# EAGLE design Box of Beezz - Drone Synth V2 (EAGLE 9.6.2)
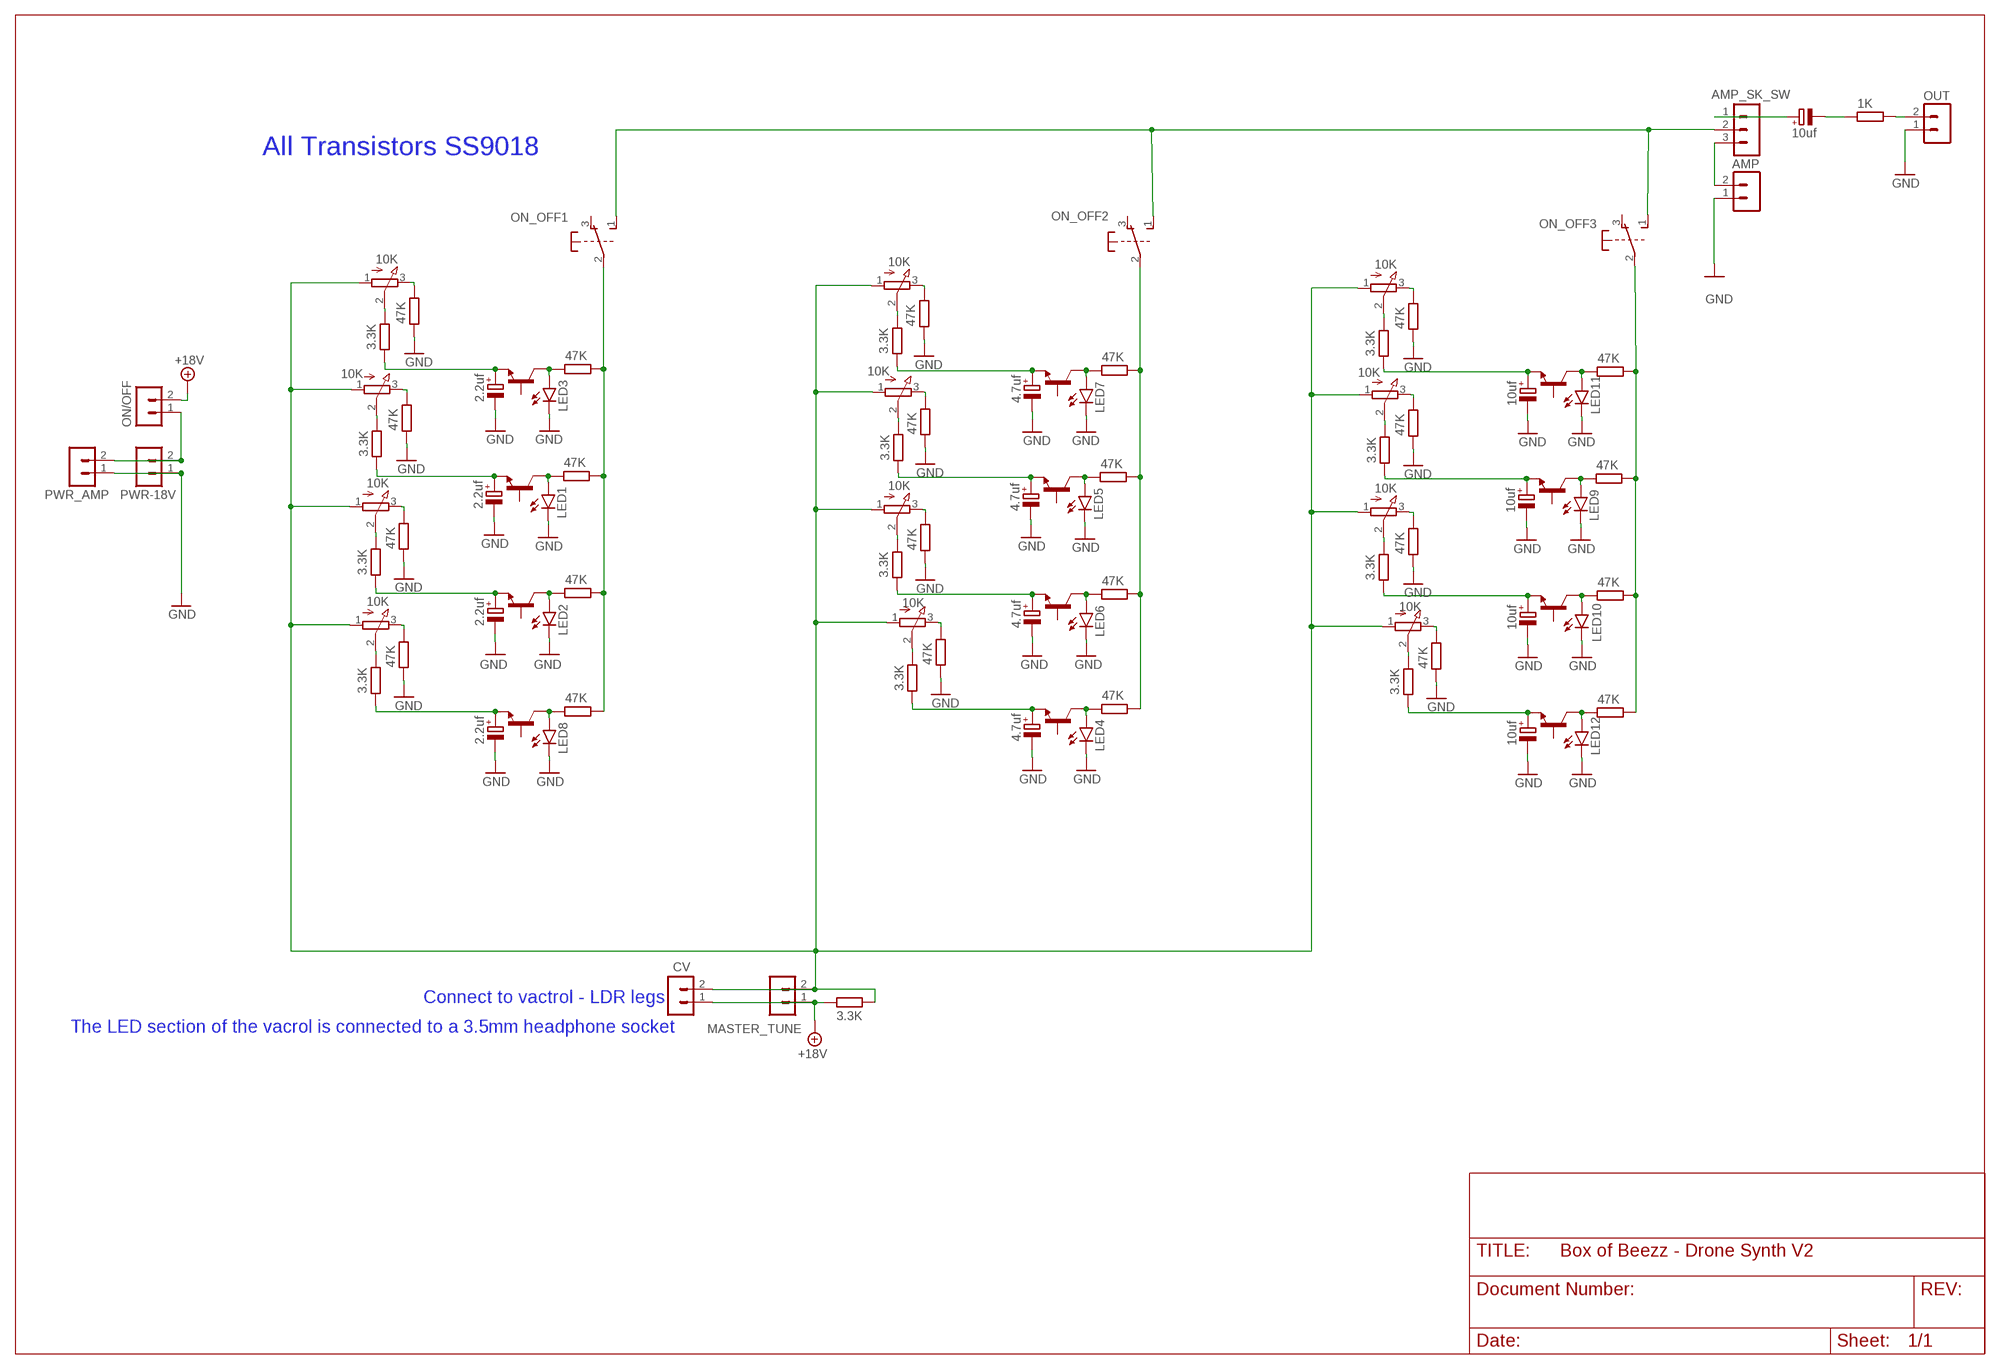
[diagram p0: schematic, sheet 1]

## Parts
AMP  B2B-PH-KL  [B2B-PH-K-S]
AMP_SK_SW  B3B-PH-K-S  [B3B-PH-K-S]
C1  2.2uf  CPOL-EUE2-5  [E2-5]
C2  2.2uf  CPOL-EUE2-5  [E2-5]
C3  2.2uf  CPOL-EUE2-5  [E2-5]
C4  10uf  CPOL-EUE2-5  [E2-5]
C5  4.7uf  CPOL-EUE2-5  [E2-5]
C6  4.7uf  CPOL-EUE2-5  [E2-5]
C7  4.7uf  CPOL-EUE2-5  [E2-5]
C8  4.7uf  CPOL-EUE2-5  [E2-5]
C9  2.2uf  CPOL-EUE2-5  [E2-5]
C10  10uf  CPOL-EUE2-5  [E2-5]
C11  10uf  CPOL-EUE2-5  [E2-5]
C12  10uf  CPOL-EUE2-5  [E2-5]
C13  10uf  CPOL-EUE2-5  [E2-5]
CV  B2B-PH-KL  [B2B-PH-K-S]
LED1  LED3MM  [LED3MM]
LED2  LED3MM  [LED3MM]
LED3  LED3MM  [LED3MM]
LED4  LED3MM  [LED3MM]
LED5  LED3MM  [LED3MM]
LED6  LED3MM  [LED3MM]
LED7  LED3MM  [LED3MM]
LED8  LED3MM  [LED3MM]
LED9  LED3MM  [LED3MM]
LED10  LED3MM  [LED3MM]
LED11  LED3MM  [LED3MM]
LED12  LED3MM  [LED3MM]
MASTER_TUNE  B2B-PH-KL  [B2B-PH-K-S]
ON/OFF  B2B-PH-KL  [B2B-PH-K-S]
ON_OFF1  SWITCH-6PIN  [SWITCH-6PIN]
ON_OFF2  SWITCH-6PIN  [SWITCH-6PIN]
ON_OFF3  SWITCH-6PIN  [SWITCH-6PIN]
OUT  B2B-PH-KL  [B2B-PH-K-S]
PWR-18V  B2B-PH-KL  [B2B-PH-K-S]
PWR_AMP  B2B-PH-KL  [B2B-PH-K-S]
R1  47K  R-EU_0207/10  [0207/10]
R2  10K  EVUF2A  [EVUF]
R3  47K  R-EU_0207/10  [0207/10]
R4  3.3K  R-EU_0207/10  [0207/10]
R5  47K  R-EU_0207/10  [0207/10]
R6  10K  EVUF2A  [EVUF]
R7  3.3K  R-EU_0207/10  [0207/10]
R8  47K  R-EU_0207/10  [0207/10]
R9  10K  EVUF2A  [EVUF]
R10  3.3K  R-EU_0207/10  [0207/10]
R11  3.3K  R-EU_0207/10  [0207/10]
R12  1K  R-EU_0207/10  [0207/10]
R13  47K  R-EU_0207/10  [0207/10]
R14  47K  R-EU_0207/10  [0207/10]
R15  10K  EVUF2A  [EVUF]
R16  10K  EVUF2A  [EVUF]
R17  47K  R-EU_0207/10  [0207/10]
R18  47K  R-EU_0207/10  [0207/10]
R19  10K  EVUF2A  [EVUF]
R20  47K  R-EU_0207/10  [0207/10]
R21  47K  R-EU_0207/10  [0207/10]
R22  10K  EVUF2A  [EVUF]
R23  3.3K  R-EU_0207/10  [0207/10]
R24  3.3K  R-EU_0207/10  [0207/10]
R25  3.3K  R-EU_0207/10  [0207/10]
R26  3.3K  R-EU_0207/10  [0207/10]
R27  47K  R-EU_0207/10  [0207/10]
R28  10K  EVUF2A  [EVUF]
R29  3.3K  R-EU_0207/10  [0207/10]
R30  3.3K  R-EU_0207/10  [0207/10]
R31  47K  R-EU_0207/10  [0207/10]
R32  10K  EVUF2A  [EVUF]
R33  3.3K  R-EU_0207/10  [0207/10]
R34  47K  R-EU_0207/10  [0207/10]
R35  10K  EVUF2A  [EVUF]
R36  47K  R-EU_0207/10  [0207/10]
R37  47K  R-EU_0207/10  [0207/10]
R38  47K  R-EU_0207/10  [0207/10]
R39  47K  R-EU_0207/10  [0207/10]
R40  47K  R-EU_0207/10  [0207/10]
R41  47K  R-EU_0207/10  [0207/10]
R42  47K  R-EU_0207/10  [0207/10]
R43  47K  R-EU_0207/10  [0207/10]
R44  10K  EVUF2A  [EVUF]
R45  3.3K  R-EU_0207/10  [0207/10]
R46  47K  R-EU_0207/10  [0207/10]
R47  47K  R-EU_0207/10  [0207/10]
R48  10K  EVUF2A  [EVUF]
R49  3.3K  R-EU_0207/10  [0207/10]
R50  47K  R-EU_0207/10  [0207/10]
T1  2N3904  [TO92]
T2  2N3904  [TO92]
T3  2N3904  [TO92]
T4  2N3904  [TO92]
T5  2N3904  [TO92]
T6  2N3904  [TO92]
T7  2N3904  [TO92]
T8  2N3904  [TO92]
T9  2N3904  [TO92]
T10  2N3904  [TO92]
T11  2N3904  [TO92]
T12  2N3904  [TO92]

## Nets
+12V: CV.1 MASTER_TUNE.1 ON/OFF.2 R11.1 ; supply symbol labelled +18V
GND: AMP.1 C1.- C2.- C3.- C5.- C6.- C7.- C8.- C9.- C10.- C11.- C12.- C13.- LED1.K(C) LED2.K(C) LED3.K(C) LED4.K(C) LED5.K(C) LED6.K(C) LED7.K(C) LED8.K(C) LED9.K(C) LED10.K(C) LED11.K(C) LED12.K(C) OUT.1 PWR-18V.1 PWR_AMP.1 R13.1 R17.1 R20.1 R36.1 R37.1 R38.1 R39.1 R40.1 R41.1 R42.1 R46.1 R50.1
N$1: C1.+ R7.1 T1.3(E)
N$2: R4.2 R9.2(S)
N$4: LED1.A R1.1 T1.1(C)
N$5: LED2.A R5.1 T2.1(C)
N$6: C2.+ R10.1 T2.3(E)
N$7: R2.2(S) R7.2
N$8: LED3.A R8.1 T3.1(C)
N$9: C3.+ R4.1 T3.3(E)
N$10: R6.2(S) R10.2
N$11: R6.3(E) R20.2
N$12: R2.3(E) R17.2
N$13: R9.3(E) R13.2
N$14: LED5.A R14.1 T5.1(C)
N$15: C8.+ R23.1 T7.3(E)
N$16: ON/OFF.1 PWR-18V.2 PWR_AMP.2
N$17: LED8.A R3.1 T4.1(C)
N$18: R28.2(S) R30.2
N$19: LED6.A R18.1 T6.1(C)
N$20: C5.+ R24.1 T5.3(E)
N$21: R32.2(S) R33.2
N$23: C7.+ R25.1 T6.3(E)
N$24: ON_OFF2.2(1:P) R14.2 R18.2 R21.2 R43.2
N$25: ON_OFF3.2(1:P) R27.2 R31.2 R34.2 R47.2
N$26: C4.- R12.1
N$27: AMP_SK_SW.1 C4.+
N$28: C9.+ R29.1 T4.3(E)
N$29: OUT.2 R12.2
N$30: LED9.A R27.1 T9.1(C)
N$31: C13.+ R26.1 T11.3(E)
N$32: AMP.2 AMP_SK_SW.3
N$33: LED10.A R31.1 T10.1(C)
N$34: C11.+ R30.1 T9.3(E)
N$35: R26.2 R35.2(S)
N$36: LED11.A R34.1 T11.1(C)
N$37: C12.+ R33.1 T10.3(E)
N$38: R22.2(S) R23.2
N$39: R15.2(S) R24.2
N$40: R19.2(S) R25.2
N$41: LED7.A R21.1 T7.1(C)
N$42: ON_OFF1.2(1:P) R1.2 R3.2 R5.2 R8.2
N$43: AMP_SK_SW.2 ON_OFF1.1(1:S) ON_OFF2.1(1:S) ON_OFF3.1(1:S)
N$44: R32.3(E) R41.2
N$45: R28.3(E) R40.2
N$46: R35.3(E) R39.2
N$47: R22.3(E) R36.2
N$48: R15.3(E) R37.2
N$49: R19.3(E) R38.2
N$51: R16.2(S) R29.2
N$52: R16.3(E) R42.2
N$53: LED4.A R43.1 T8.1(C)
N$54: C6.+ R45.1 T8.3(E)
N$57: R44.2(S) R45.2
N$58: R44.3(E) R46.2
N$59: LED12.A R47.1 T12.1(C)
N$60: C10.+ R49.1 T12.3(E)
N$62: CV.2 MASTER_TUNE.2 R2.1(A) R6.1(A) R9.1(A) R11.2 R15.1(A) R16.1(A) R19.1(A) R22.1(A) R28.1(A) R32.1(A) R35.1(A) R44.1(A) R48.1(A)
N$63: R48.2(S) R49.2
N$64: R48.3(E) R50.2
Unconnected: ON_OFF1.3(1:O) ON_OFF1.4(2:S) ON_OFF1.5(2:P) ON_OFF1.6(2:O) ON_OFF2.3(1:O) ON_OFF2.4(2:S) ON_OFF2.5(2:P) ON_OFF2.6(2:O) ON_OFF3.3(1:O) ON_OFF3.4(2:S) ON_OFF3.5(2:P) ON_OFF3.6(2:O) T1.2(B) T2.2(B) T3.2(B) T4.2(B) T5.2(B) T6.2(B) T7.2(B) T8.2(B) T9.2(B) T10.2(B) T11.2(B) T12.2(B)

## Notes on the sheet
- All Transistors SS9018
- Connect to vactrol - LDR legs
- The LED section of the vacrol is connected to a 3.5mm headphone socket

## Library data of the parts
AMP CV MASTER_TUNE ON/OFF OUT PWR-18V PWR_AMP = con-JST PH:B2B-PH: JST PH series header 2.00mm pitch disconnectable crimp style connectors, vertical (side entry type), 2 pins
AMP_SK_SW = con-JST PH:B3B-PH: JST PH series header 2.00mm pitch disconnectable crimp style connectors, vertical (side entry type), 3 pins
C1-C13 = rcl:CPOL-EU: POLARIZED CAPACITOR, European symbol; SPICEPREFIX: C
LED1-LED12 = led:LED: LED OSRAM: - CHIPLED LG R971, LG N971, LY N971, LG Q971, LY Q971, LO R971, LY R971 LH N974, LH R974 LS Q976, LO Q976, LY Q976 LO Q996 - Hyper CHIPLED LW Q18S LB Q993, LB Q99A, LB R99A - SideLED LS A670, LO A670, LY A670, LG A670, LP A670 LB A673, LV A673, LT A673, LW A673 LH A674 LY A675 LS A676, LA A676, LO A676, LY A676, LW A676 LS A679, LY A679, LG A679 - Hyper Micro SIDELED® LS Y876, LA Y876, LO Y876, LY Y876 LT Y87S - SmartLED LW L88C, LW L88S LB L89C, LB L89S, LG L890 LS L89K, LO L89K, LY L89K LS L896, LA L896, LO L896, LY L896 - TOPLED LS T670, LO T670, LY T670, LG T670, LP T670 LSG T670, LSP T670, LSY T670, LOP T670, LYG T670 LG T671, LOG T671, LSG T671 LB T673, LV T673, LT T673, LW T673 LH T674 LS T676, LA T676, LO T676, LY T676, LB T676, LH T676, LSB T676, LW T676 LB T67C, LV T67C, LT T67C, LS T67K, LO T67K, LY T67K, LW E67C LS E67B, LA E67B, LO E67B, LY E67B, LB E67C, LV E67C, LT E67C LW T67C LS T679, LY T679, LG T679 LS T770, LO T770, LY T770, LG T770, LP T770 LB T773, LV T773, LT T773, LW T773 LH T774 LS E675, LA E675, LY E675, LS T675 LS T776, LA T776, LO T776, LY T776, LB T776 LHGB T686 LT T68C, LB T68C - Hyper Mini TOPLED® LB M676 - Mini TOPLED Santana® LG M470 LS M47K, LO M47K, LY M47K Source: http://www.osram.convergy.de LUXEON: - LUMILED® LXK2-PW12-R00, LXK2-PW12-S00, LXK2-PW14-U00, LXK2-PW14-V00 LXK2-PM12-R00, LXK2-PM12-S00, LXK2-PM14-U00 LXK2-PE12-Q00, LXK2-PE12-R00, LXK2-PE12-S00, LXK2-PE14-T00, LXK2-PE14-U00 LXK2-PB12-K00, LXK2-PB12-L00, LXK2-PB12-M00, LXK2-PB14-N00, LXK2-PB14-P00, LXK2-PB14-Q00 LXK2-PR12-L00, LXK2-PR12-M00, LXK2-PR14-Q00, LXK2-PR14-R00 LXK2-PD12-Q00, LXK2-PD12-R00, LXK2-PD12-S00 LXK2-PH12-R00, LXK2-PH12-S00 LXK2-PL12-P00, LXK2-PL12-Q00, LXK2-PL12-R00 Source: www.luxeon.com KINGBRIGHT: KA-3528ASYC Source: www.kingbright.com
ON_OFF1-ON_OFF3 = My Library:SWITCH-6PIN: ITT SWITCH
R1 R3-R5 R7 R8 R10-R14 R17 R18 R20 R21 R23-R27 R29-R31 R33 R34 R36-R43 R45-R47 R49 R50 = rcl:R-EU_: RESISTOR, European symbol; SPICEPREFIX: R
R2 R6 R9 R15 R16 R19 R22 R28 R32 R35 R44 R48 = pot:EVU: 9 mm Square Rotary Potentiometers Source: Panasonic
T1-T12 = transistor:2N3904: NPN TRANSISTOR

## Board
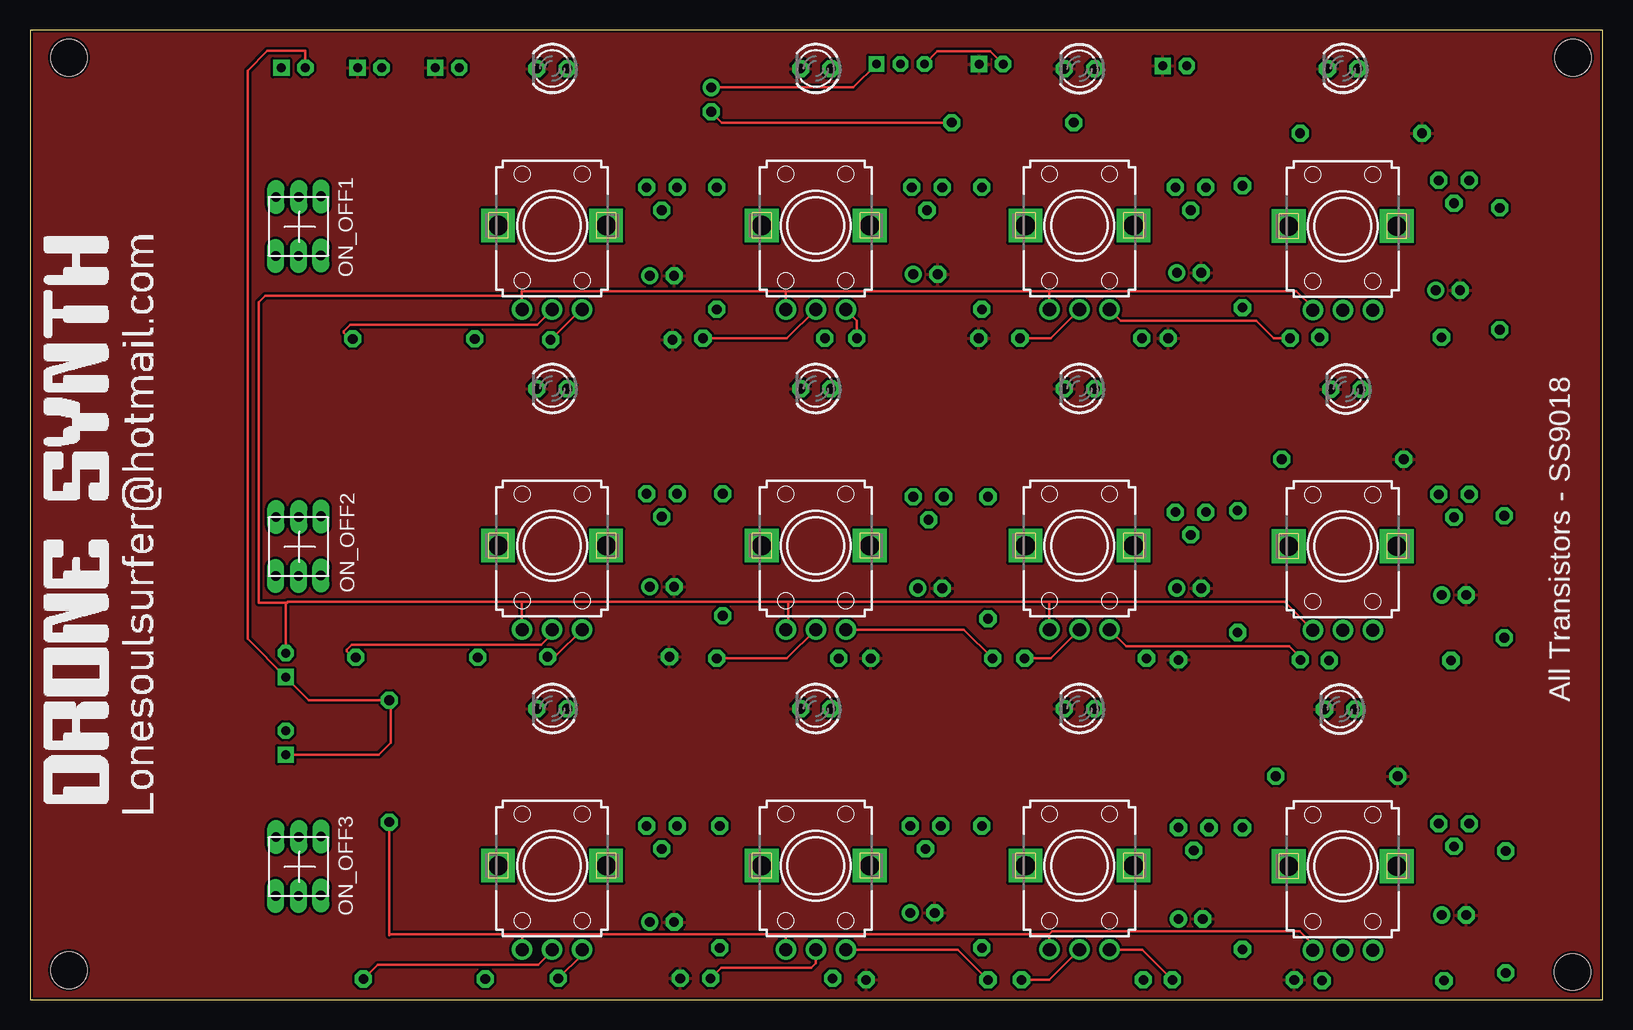
[diagram p1: board, top side]
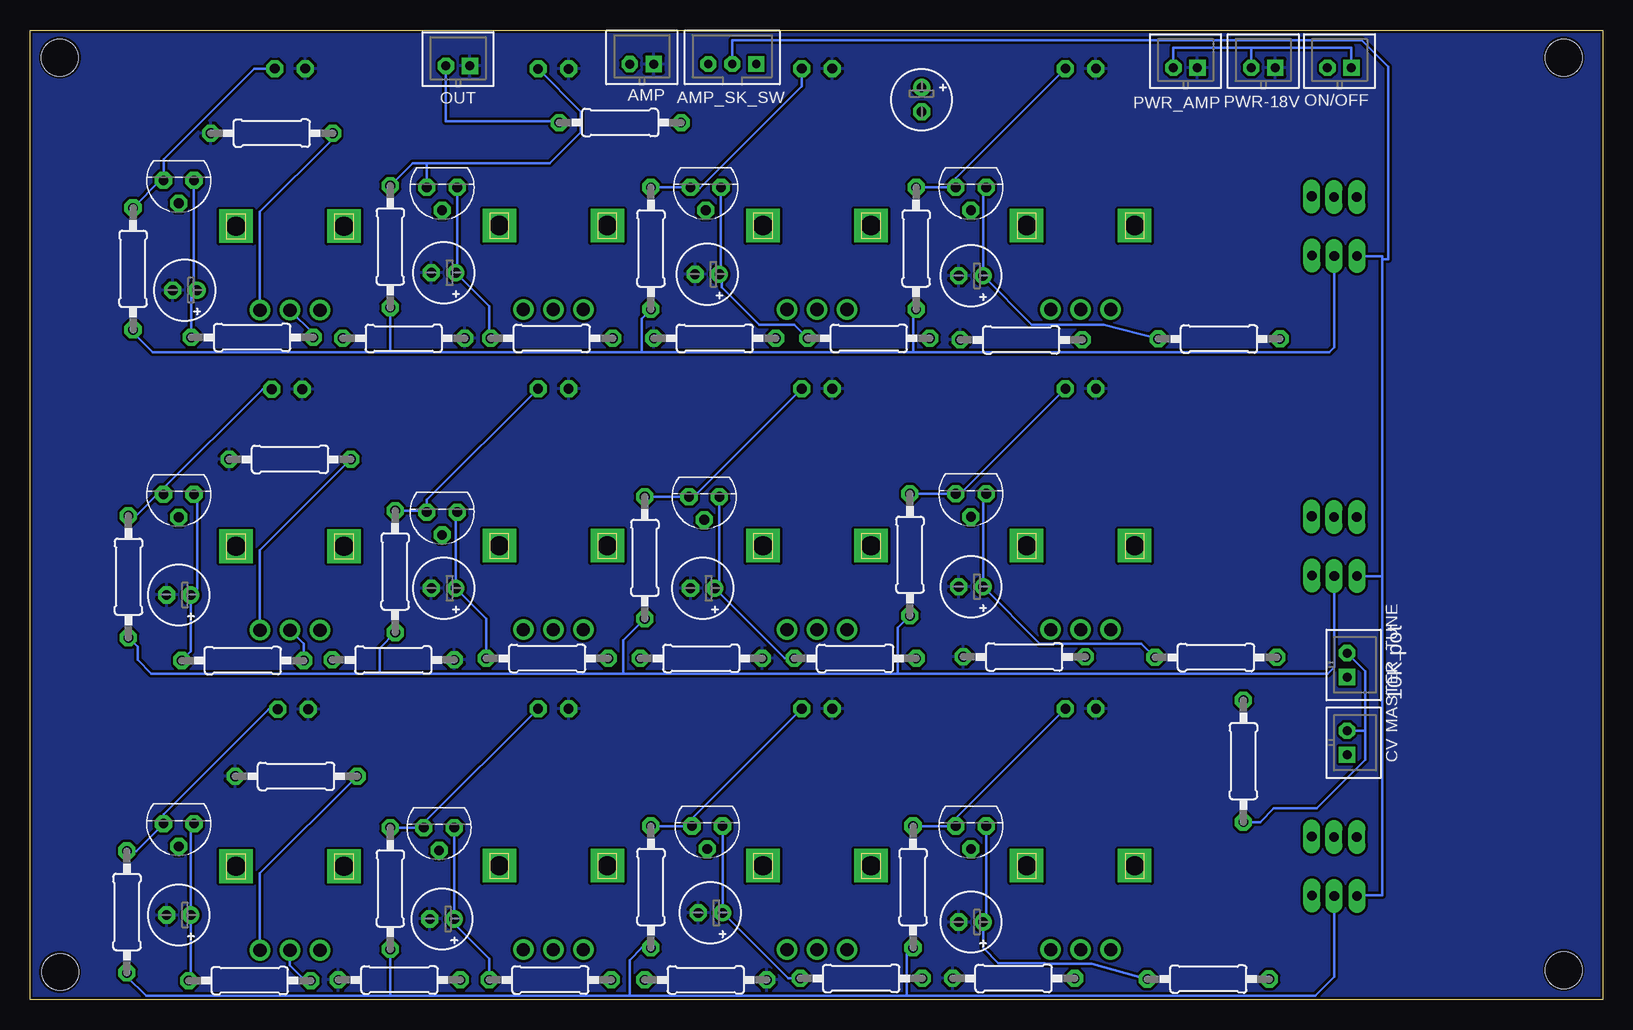
[diagram p2: board, bottom side, seen from below]

Size 131.06 x 80.81 mm. Coordinates in mm from the lower left corner, seen from the top.
Outline: 0,0 131.06,0 131.06,80.81 0,80.79 0,0
Copper layers (1*16): Top 0.035mm / dielectric 1.5mm / Bottom 0.035mm
Design rules "SparkFun": minimum track width 8mil, minimum drill 20mil, track to track 8mil, track to pad 8mil, pad to pad 8mil, via to via 8mil, smd to smd 8mil, copper to edge 8mil, drill to drill 8mil, minimum pad ring 12mil, minimum via ring 10mil, stop-mask expansion 4mil, vias tented up to drill 20mil, thermal gap 10mil
Holes 3.05 mm at 3.25,78.51 3.25,2.46 128.55,2.31 128.57,78.51

### Footprints (pad centres in the part's own frame; a part is rotated, then mirrored left to right if it is on the bottom)
B2B-PH-K-S = drill 0.75 pad 1.3 square: 1 1,0 | drill 0.75 pad 1.3 octagon: 2 -1,0
B3B-PH-K-S = drill 0.7 pad 1.3 square: 1 2,0 | drill 0.7 pad 1.3 octagon: 2 0,0; 3 -2,0
E2-5 = drill 0.813 pad 1.27: + -1.016,0 | drill 0.813 pad 1.27 octagon: - 1.016,0
LED3MM = drill 0.813 octagon: A -1.27,0; K 1.27,0
SWITCH-6PIN = drill 0.813 long: 1 -2.997,2.489; 2 -2.997,0.584; 3 -2.946,-1.27; 4 1.93,2.464; 5 1.93,0.559; 6 1.981,-1.295
0207/10 = drill 0.813 octagon: 1 -5.08,0; 2 5.08,0
EVUF = drill 1.1 pad 1.676: 1 -2.5,-7; 2 0,-7; 3 2.5,-7 | drill 1.6 pad 2.8 square: M1 4.5,0; M2 -4.5,0
TO92 = drill 0.813 octagon: 1 1.27,0; 2 0,1.905; 3 -1.27,0

### Placement (x,y rotation side)
AMP  80.09,77.98 0 bottom
AMP_SK_SW  72.54,77.98 0 bottom
C1  52.65,60.33 180 bottom
C2  74.63,60.45 180 bottom
C3  96.6,60.58 180 bottom
C4  56.77,75.01 270 bottom
C5  52.65,34.42 180 bottom
C6  118.67,33.73 180 bottom
C7  75.01,34.29 180 bottom
C8  96.6,34.29 180 bottom
C9  118.16,59.13 180 bottom
C10  118.67,7.06 180 bottom
C11  52.65,6.48 180 bottom
C12  74.37,7.24 180 bottom
C13  96.72,6.73 180 bottom
CV  21.31,21.41 270 bottom
LED1  43.51,77.6 180 top
LED2  65.48,77.6 180 top
LED3  87.45,77.57 180 top
LED4  109.65,50.88 180 top
LED5  43.51,50.93 180 top
LED6  65.48,50.93 180 top
LED7  87.45,50.93 180 top
LED8  109.4,77.6 180 top
LED9  43.51,24.26 180 top
LED10  65.48,24.26 180 top
LED11  87.45,24.26 180 top
LED12  109.14,24.21 180 top
MASTER_TUNE  21.31,27.89 270 bottom
ON/OFF  21.95,77.67 0 bottom
ON_OFF1  22.96,64.97 90 top
ON_OFF2  22.96,38.3 90 top
ON_OFF3  22.96,11.63 90 top
OUT  95.4,77.83 0 bottom
PWR-18V  28.3,77.67 0 bottom
PWR_AMP  34.77,77.67 0 bottom
R1  57.23,62.61 270 bottom
R2  43.51,64.52 0 top
R3  122.48,60.91 270 bottom
R4  87.58,55.12 0 bottom
R5  79.32,62.61 270 bottom
R6  65.48,64.52 0 top
R7  31.98,55.07 0 bottom
R8  101.04,62.76 270 bottom
R9  87.45,64.52 0 top
R10  61.16,55.12 0 bottom
R11  29.95,19.89 270 bottom
R12  81.89,73.1 180 bottom
R13  99.92,55.12 180 bottom
R14  57.73,37.08 270 bottom
R15  43.51,37.85 0 top
R16  109.4,64.47 0 top
R17  48.46,54.99 0 bottom
R18  79.83,36.83 270 bottom
R19  65.48,37.85 0 top
R20  73.99,55.12 0 bottom
R21  100.63,35.69 270 bottom
R22  87.45,37.85 0 top
R23  87.96,28.45 0 bottom
R24  32.23,28.52 0 bottom
R25  62.31,28.45 0 bottom
R26  87.71,1.65 0 bottom
R27  57.48,9.4 270 bottom
R28  43.51,11.18 0 top
R29  112.55,55.19 0 bottom
R30  32.87,1.73 0 bottom
R31  79.32,9.4 270 bottom
R32  65.48,11.18 0 top
R33  61.8,1.78 0 bottom
R34  101.04,9.27 270 bottom
R35  87.45,11.18 0 top
R36  100.79,28.32 180 bottom
R37  48.21,28.57 0 bottom
R38  75.13,28.45 180 bottom
R39  100.28,1.65 0 bottom
R40  49.1,1.78 0 bottom
R41  74.75,1.65 180 bottom
R42  110.92,72.21 0 bottom
R43  122.86,35.26 270 bottom
R44  109.4,37.8 0 top
R45  113.33,28.27 0 bottom
R46  109.4,45.03 0 bottom
R47  122.99,7.32 270 bottom
R48  109.4,11.13 0 top
R49  112.75,1.6 0 bottom
R50  108.89,18.62 0 bottom
T1  52.65,67.69 180 bottom
T2  74.75,67.69 180 bottom
T3  96.72,67.69 180 bottom
T4  118.67,68.28 180 bottom
T5  52.65,42.16 180 bottom
T6  74.88,41.91 180 bottom
T7  96.72,40.64 180 bottom
T8  118.67,42.11 180 bottom
T9  52.65,14.48 180 bottom
T10  74.63,14.48 180 bottom
T11  96.98,14.35 180 bottom
T12  118.67,14.68 180 bottom

### Tracks (layer width: path | path; a pad name or v marks a point on that pad's centre or on a via)
+12V
  Top 0.203: ON/OFF.2 22.95,79.07 19.79,79.07 18.14,77.42 18.14,30.06 MASTER_TUNE.1 23.23,24.97 R11.1 30.07,24.84 30.07,21.41 29.07,20.41 CV.1
GND
  pour Top: 0,80.77 131.04,80.77 131.04,0 0,0
  pour Bottom: 0,80.77 131.04,80.77 131.04,0 0,0
N$1
  Bottom 0.203: T1.3 51.64,67.44 C1.+ 47.57,56.26 41.61,56.26 R7.1
N$2
  Top 0.203: R9.2 85.05,55.12 R4.2
N$4
  Bottom 0.203: LED1.A 53.92,68.45 T1.1 R1.1
N$5
  Bottom 0.203: LED2.A 66.75,76.12 75.23,67.64 75.97,67.64 T2.1 R5.1
N$6
  Bottom 0.203: T2.3 73.48,60.58 C2.+ 73.42,60.26 73.42,59.37 70.31,56.26 67.39,56.26 R10.1
N$7
  Top 0.203: R7.2 26.64,55.07 26.14,55.58 26.14,55.7 26.7,56.26 42.26,56.26 R2.2
N$8
  Bottom 0.203: T3.1 97.99,69.72 | 97.99,69.72 87.73,69.72 85.17,72.29 85.17,74.02 LED3.A | 97.99,69.72 99.16,69.72 R8.1
N$9
  Bottom 0.203: T3.3 95.45,60.71 C3.+ 92.79,57.79 92.79,55.25 R4.1
N$10
  Top 0.203: R10.2 63.08,55.12 R6.2
N$11
  Top 0.203: R6.3 68.91,56.59 R20.2
N$12
  Top 0.203: R17.2 45.91,57.52 R2.3
N$13
  Top 0.203: R9.3 90.9,56.57 102.18,56.57 103.63,55.12 R13.2
N$14
  Bottom 0.203: LED5.A 53.54,42.16 T5.1 R14.1
N$15
  Bottom 0.203: T7.3 95.58,40.51 C8.+ 93.04,31.75 R23.1
N$16
  Bottom 0.203: PWR-18V.2 29.3,79.34 | ON/OFF.1 20.95,79.34 29.3,79.34 | 29.3,79.34 35.77,79.34 PWR_AMP.2
N$17
  Bottom 0.203: LED8.A 112.39,77.6 119.94,70.05 T4.1 120.19,68.28 R3.1
N$18
  Top 0.203: R30.2 28.98,2.92 42.37,2.92 43.51,4.06 R28.2
N$19
  Bottom 0.203: LED6.A 75.77,41.91 T6.1 R18.1
N$20
  Bottom 0.203: T5.3 51.64,41.91 C5.+ 46.91,29.69 38.47,29.69 R24.1
N$21
  Top 0.203: R33.2 57.61,2.67 65.1,2.67 65.48,3.05 R32.2
N$23
  Bottom 0.203: T6.3 73.61,34.67 C7.+ 68.15,28.45 R25.1
N$24
  Bottom 0.203: ON_OFF2.2 22.38,27.71 22.91,27.18 58.75,27.18 | 81.61,27.18 101.93,27.18 | 101.93,27.18 110.08,27.18 120.95,27.18 122.1,28.32 122.1,29.41 R43.2 | R21.2 101.93,29.31 101.93,27.18 | R14.2 58.75,30.99 58.75,27.18 | 81.61,27.18 81.61,29.97 R18.2 | 81.61,27.18 58.75,27.18
N$25
  Bottom 0.203: ON_OFF3.2 22.38,1.93 23.98,0.33 57.99,0.33 | R27.2 57.99,3.81 57.99,0.33 | 81.1,0.33 101.04,0.33 | R34.2 101.04,0.33 | R31.2 80.09,4.32 81.1,3.3 81.1,0.33 | 81.1,0.33 57.99,0.33 | 101.04,0.33 121.39,0.33 122.99,1.93 R47.2
N$26
  Top 0.203: R12.1 57.66,73.1 C4.-
N$27
  Top 0.203: AMP_SK_SW.1 68.59,76.02 C4.+
N$28
  Bottom 0.203: T4.3 117.4,59.39 C9.+ 117.63,58.65 R29.1
N$29
  Bottom 0.203: OUT.2 96.4,73.2 87.07,73.2 R12.2
N$30
  Bottom 0.203: LED9.A 53.92,15.11 T9.1 R27.1
N$31
  Bottom 0.203: T11.3 C13.+ 95.71,6.35 92.79,3.43 R26.1
N$32
  Top 0.203: AMP.2 80.02,79.05 75.61,79.05 AMP_SK_SW.3
N$33
  Bottom 0.203: LED10.A 75.9,15.11 T10.1 R31.1
N$34
  Bottom 0.203: T9.3 51.38,6.73 C11.+ 51.64,4.32 50.37,3.05 46.52,3.05 46.49,3.02 42.59,3.02 R30.1
N$35
  Top 0.203: R26.2 84.93,1.65 R35.2
N$36
  Bottom 0.203: LED11.A 98.25,14.73 T11.1 R34.1
N$37
  Bottom 0.203: T10.3 C12.+ 67.89,1.78 R33.1
N$38
  Top 0.203: R23.2 85.05,28.45 R22.2
N$39
  Top 0.203: R24.2 26.9,28.52 26.39,29.03 26.39,29.16 26.82,29.59 42.62,29.59 43.51,30.48 R15.2
N$40
  Top 0.203: R25.2 63.08,28.45 R19.2
N$41
  Bottom 0.203: LED7.A 97.99,41.66 T7.1 98.12,40.77 R21.1
N$42
  Bottom 0.203: ON_OFF1.2 22.38,54.38 22.78,53.98 57.48,53.98 | R1.2 57.48,57.28 57.48,53.98 | 57.48,53.98 80.09,53.98 | R5.2 80.09,56.77 80.09,53.98 | 80.09,53.98 101.04,53.98 | R8.2 101.04,54.1 101.04,53.98 | 101.04,53.98 101.04,53.95 120.85,53.95 122.48,55.58 R3.2
N$43
  Bottom 0.203: ON_OFF1.1 18.39,61.98 18.39,61.72 | 18.39,61.72 17.88,61.72 17.88,77.74 20.1,79.96 72.54,79.96 AMP_SK_SW.2 | ON_OFF2.1 18.39,35.31 | 18.39,61.72 18.39,35.31 | ON_OFF3.1 20.4,8.71 18.39,8.71 18.39,35.31
N$44
  Top 0.203: R32.3 77.31,4.18 R41.2
N$45
  Top 0.203: R40.2 46.01,3.77 R28.3
N$46
  Top 0.203: R35.3 92.67,4.18 R39.2
N$47
  Top 0.203: R22.3 91.33,29.46 104.93,29.46 105.77,28.63 105.77,28.42 R36.2
N$48
  Top 0.203: R15.3 43.82,28.65 43.21,28.65 R37.2
N$49
  Top 0.203: R19.3 77.82,30.85 R38.2
N$51
  Bottom 0.203: R29.2 107.47,55.54 R16.2
N$52
  Bottom 0.203: R42.2 105.84,71.7 111.9,65.65 R16.3
N$53
  Bottom 0.203: 120.19,42.37 111.68,50.88 LED4.A | R43.1 122.22,40.34 120.19,42.37 | T8.1 120.19,42.37
N$54
  Bottom 0.203: T8.3 117.14,41.86 117.14,34.24 C6.+ 117.65,29.03 R45.1
N$57
  Bottom 0.203: R45.2 108.25,29.65 R44.2
N$58
  Bottom 0.203: R46.2 111.9,37.45 R44.3
N$59
  Bottom 0.203: LED12.A 111.18,24.21 119.94,15.44 T12.1 122.22,12.4 R47.1
N$60
  Bottom 0.203: T12.3 117.65,14.43 C10.+ 117.65,1.78 R49.1
N$62
  Top 0.203: R11.2 29.95,5.4 30.01,5.46 41.01,5.46 | 62.98,5.46 41.01,5.46 | 62.98,5.46 R32.1 | 62.98,5.46 84.95,5.46 | R35.1 84.95,5.46 | 21.44,33.1 19.05,33.1 19.05,58.14 19.58,58.67 40.97,58.67 | 40.97,33.15 21.49,33.15 21.44,33.1 | 40.97,33.15 63.2,33.15 | 63.2,33.15 63.2,31.06 R19.1 | 63.2,33.15 84.95,33.15 | 84.95,33.15 R22.1 | R2.1 40.97,57.56 40.97,58.67 | 40.97,58.67 40.97,59.06 62.94,59.06 | 62.94,59.06 62.98,59.02 R6.1 | 62.94,59.06 84.91,59.06 | 84.91,59.06 84.95,59.02 R9.1 | R15.1 40.97,30.89 40.97,33.15 | R28.1 41.01,5.46 | MASTER_TUNE.2 21.31,32.97 21.44,33.1 | 84.91,59.06 105.54,59.06 106.9,57.69 R16.1 | R44.1 104.55,33.15 84.95,33.15 | R48.1 106.9,4.61 105.8,5.7 85.19,5.7 84.95,5.46
  Bottom 0.203: MASTER_TUNE.2 19.79,27.37 19.79,22.43 | 19.79,22.43 19.79,20 23.83,15.95 27.41,15.95 28.55,14.81 R11.2 | CV.2 19.8,22.41 19.79,22.43
N$63
  Bottom 0.203: R49.2 108.13,1.6 109.4,2.87 R48.2
N$64
  Bottom 0.203: R50.2 111.9,10.53 R48.3

### Text on the board
tPlace: All Transistors - SS9018
bPlace: 10K pot